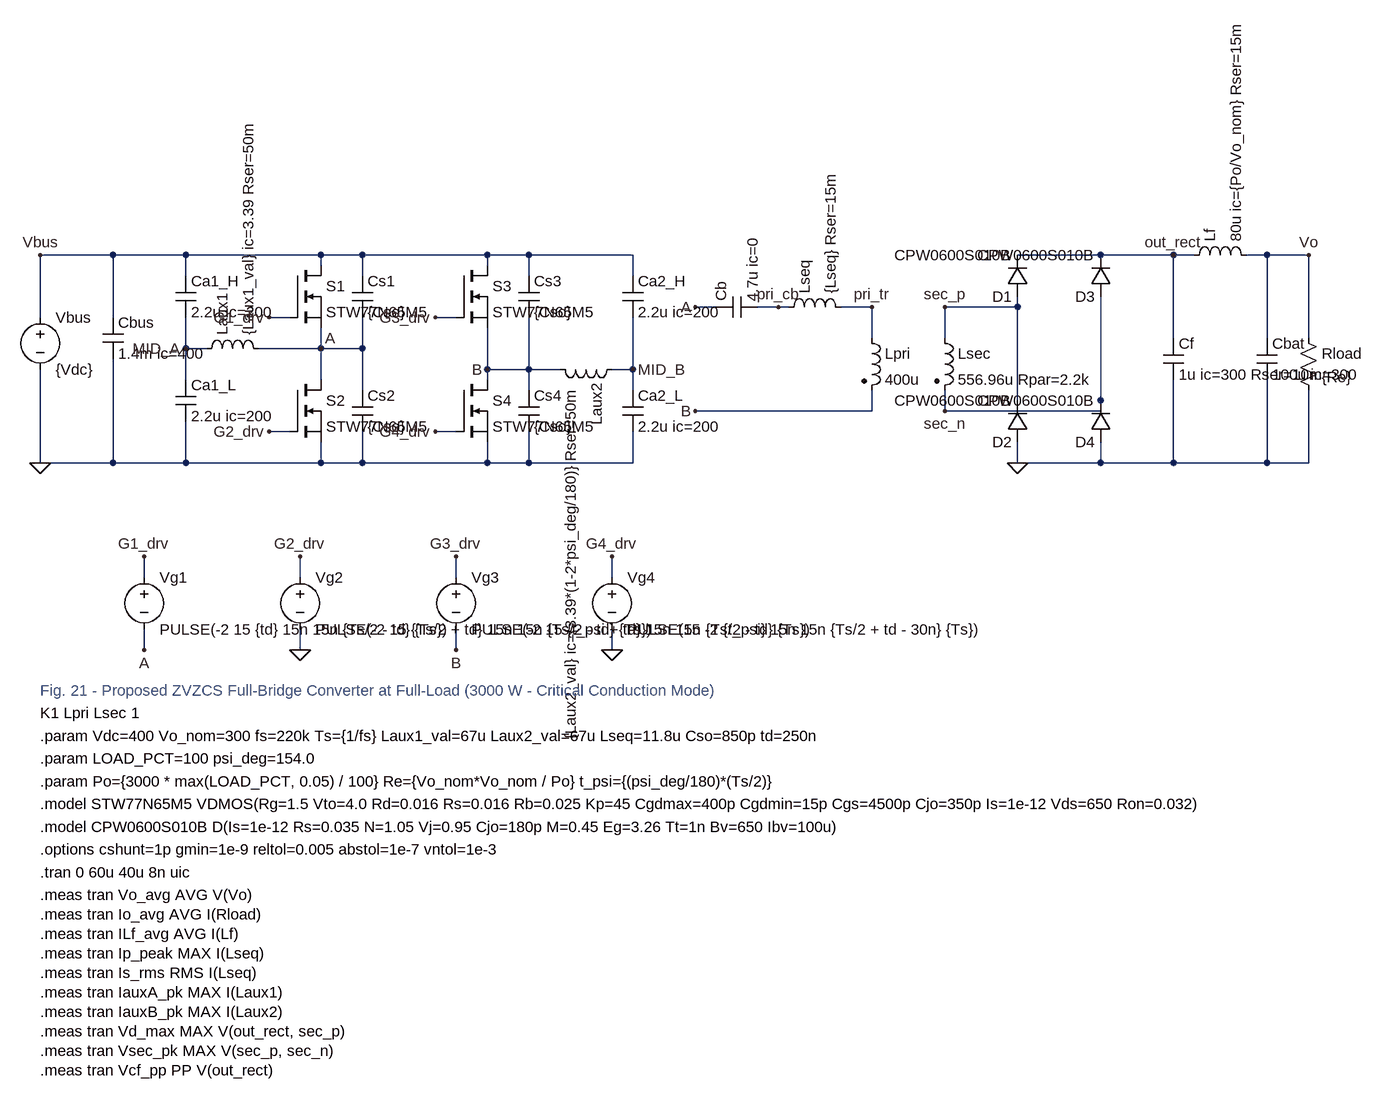
[diagram p0: schematic Fig21_Proposed_100pct_FullLoad_3000W.asc]
Fig21_Proposed_100pct_FullLoad_3000W.asc, the LTspice schematic file:
Version 4
SHEET 1 2400 1500
SYMBOL voltage 160 240 R0
SYMATTR InstName Vbus
SYMATTR Value {Vdc}
WIRE 160 160 160 256
WIRE 160 336 160 480
FLAG 160 480 0
FLAG 160 160 Vbus
SYMBOL cap 256 256 R0
SYMATTR InstName Cbus
SYMATTR Value 1.4m ic=400
WIRE 160 160 272 160
WIRE 272 160 272 256
WIRE 272 320 272 480
WIRE 160 480 272 480
SYMBOL cap 368 192 R0
SYMATTR InstName Ca1_H
SYMATTR Value 2.2u ic=200
WIRE 272 160 384 160
WIRE 384 160 384 192
WIRE 384 256 384 304
FLAG 384 304 MID_A
SYMBOL cap 368 352 R0
SYMATTR InstName Ca1_L
SYMATTR Value 2.2u ic=200
WIRE 384 304 384 352
WIRE 384 416 384 480
WIRE 272 480 384 480
SYMBOL ind 400 320 R270
SYMATTR InstName Laux1
SYMATTR Value {Laux1_val} ic=3.39 Rser=50m
WIRE 384 304 416 304
WIRE 496 304 592 304
SYMBOL nmos 544 176 R0
SYMATTR InstName S1
SYMATTR Value STW77N65M5
WIRE 384 160 592 160
WIRE 592 160 592 176
WIRE 512 256 544 256
FLAG 512 256 G1_drv
WIRE 592 272 592 304
FLAG 592 304 A
SYMBOL cap 640 192 R0
SYMATTR InstName Cs1
SYMATTR Value {Cso}
WIRE 592 160 656 160
WIRE 656 160 656 192
WIRE 656 256 656 304
WIRE 592 304 656 304
SYMBOL nmos 544 352 R0
SYMATTR InstName S2
SYMATTR Value STW77N65M5
WIRE 592 304 592 352
WIRE 512 432 544 432
FLAG 512 432 G2_drv
WIRE 592 448 592 480
WIRE 384 480 592 480
SYMBOL cap 640 368 R0
SYMATTR InstName Cs2
SYMATTR Value {Cso}
WIRE 656 304 656 368
WIRE 656 432 656 480
WIRE 592 480 656 480
SYMBOL nmos 800 176 R0
SYMATTR InstName S3
SYMATTR Value STW77N65M5
WIRE 656 160 848 160
WIRE 848 160 848 176
WIRE 768 256 800 256
FLAG 768 256 G3_drv
WIRE 848 272 848 336
FLAG 848 336 B
SYMBOL cap 896 192 R0
SYMATTR InstName Cs3
SYMATTR Value {Cso}
WIRE 848 160 912 160
WIRE 912 160 912 192
WIRE 912 256 912 336
WIRE 848 336 912 336
SYMBOL nmos 800 352 R0
SYMATTR InstName S4
SYMATTR Value STW77N65M5
WIRE 848 336 848 352
WIRE 768 432 800 432
FLAG 768 432 G4_drv
WIRE 848 448 848 480
WIRE 656 480 848 480
SYMBOL cap 896 368 R0
SYMATTR InstName Cs4
SYMATTR Value {Cso}
WIRE 912 336 912 368
WIRE 912 432 912 480
WIRE 848 480 912 480
SYMBOL ind 1056 320 R90
SYMATTR InstName Laux2
SYMATTR Value {Laux2_val} ic={3.39*(1-2*psi_deg/180)} Rser=50m
WIRE 912 336 960 336
WIRE 1040 336 1072 336
FLAG 1072 336 MID_B
SYMBOL cap 1056 192 R0
SYMATTR InstName Ca2_H
SYMATTR Value 2.2u ic=200
WIRE 912 160 1072 160
WIRE 1072 160 1072 192
WIRE 1072 256 1072 336
SYMBOL cap 1056 368 R0
SYMATTR InstName Ca2_L
SYMATTR Value 2.2u ic=200
WIRE 1072 336 1072 368
WIRE 1072 432 1072 480
WIRE 912 480 1072 480
FLAG 1168 240 A
FLAG 1168 400 B
SYMBOL cap 1200 256 R270
SYMATTR InstName Cb
SYMATTR Value 4.7u ic=0
WIRE 1168 240 1200 240
WIRE 1264 240 1296 240
FLAG 1296 240 pri_cb
SYMBOL ind 1296 256 R270
SYMATTR InstName Lseq
SYMATTR Value {Lseq} Rser=15m
WIRE 1296 240 1312 240
WIRE 1392 240 1440 240
FLAG 1440 240 pri_tr
SYMBOL ind2 1424 272 R0
SYMATTR InstName Lpri
SYMATTR Value 400u
WIRE 1440 240 1440 288
WIRE 1440 368 1440 400
WIRE 1168 400 1440 400
SYMBOL ind2 1536 272 R0
SYMATTR InstName Lsec
SYMATTR Value 556.96u Rpar=2.2k
WIRE 1552 240 1552 288
WIRE 1552 368 1552 400
FLAG 1552 240 sec_p
FLAG 1552 400 sec_n
SYMBOL diode 1680 224 R180
SYMATTR InstName D1
SYMATTR Value CPW0600S010B
WIRE 1664 160 1792 160
WIRE 1664 224 1664 240
WIRE 1552 240 1664 240
SYMBOL diode 1680 448 R180
SYMATTR InstName D2
SYMATTR Value CPW0600S010B
WIRE 1664 240 1664 384
WIRE 1664 448 1664 480
FLAG 1664 480 0
SYMBOL diode 1808 224 R180
SYMATTR InstName D3
SYMATTR Value CPW0600S010B
WIRE 1792 224 1792 400
WIRE 1552 400 1792 400
SYMBOL diode 1808 448 R180
SYMATTR InstName D4
SYMATTR Value CPW0600S010B
WIRE 1792 448 1792 480
WIRE 1664 480 1792 480
WIRE 1792 160 1904 160
FLAG 1904 160 out_rect
SYMBOL cap 1888 288 R0
SYMATTR InstName Cf
SYMATTR Value 1u ic=300 Rser=10m
SYMBOL ind 1920 176 R270
SYMATTR InstName Lf
SYMATTR Value 80u ic={Po/Vo_nom} Rser=15m
SYMBOL cap 2032 288 R0
SYMATTR InstName Cbat
SYMATTR Value 100u ic=300
WIRE 1904 160 1904 288
WIRE 1904 352 1904 480
WIRE 1792 480 1904 480
WIRE 1904 160 1936 160
WIRE 2016 160 2112 160
FLAG 2112 160 Vo
WIRE 2048 160 2048 288
WIRE 2048 352 2048 480
WIRE 1904 480 2048 480
SYMBOL res 2096 272 R0
SYMATTR InstName Rload
SYMATTR Value {Re}
WIRE 2112 160 2112 288
WIRE 2112 368 2112 480
WIRE 2048 480 2112 480
SYMBOL voltage 320 640 R0
SYMATTR InstName Vg1
SYMATTR Value PULSE(-2 15 {td} 15n 15n {Ts/2 - td} {Ts})
WIRE 320 624 320 656
FLAG 320 624 G1_drv
WIRE 320 736 320 768
FLAG 320 768 A
SYMBOL voltage 560 640 R0
SYMATTR InstName Vg2
SYMATTR Value PULSE(-2 15 {Ts/2 + td} 15n 15n {Ts/2 - td} {Ts})
WIRE 560 624 560 656
FLAG 560 624 G2_drv
WIRE 560 736 560 768
FLAG 560 768 0
SYMBOL voltage 800 640 R0
SYMATTR InstName Vg3
SYMATTR Value PULSE(-2 15 {t_psi + td} 15n 15n {Ts/2 - td} {Ts})
WIRE 800 624 800 656
FLAG 800 624 G3_drv
WIRE 800 736 800 768
FLAG 800 768 B
SYMBOL voltage 1040 640 R0
SYMATTR InstName Vg4
SYMATTR Value PULSE(15 -2 {t_psi} 15n 15n {Ts/2 + td - 30n} {Ts})
WIRE 1040 624 1040 656
FLAG 1040 624 G4_drv
WIRE 1040 736 1040 768
FLAG 1040 768 0
TEXT 160 830 Left 2 ;Fig. 21 - Proposed ZVZCS Full-Bridge Converter at Full-Load (3000 W - Critical Conduction Mode)
TEXT 160 865 Left 2 !K1 Lpri Lsec 1
TEXT 160 900 Left 2 !.param Vdc=400 Vo_nom=300 fs=220k Ts={1/fs} Laux1_val=67u Laux2_val=67u Lseq=11.8u Cso=850p td=250n
TEXT 160 935 Left 2 !.param LOAD_PCT=100 psi_deg=154.0
TEXT 160 970 Left 2 !.param Po={3000 * max(LOAD_PCT, 0.05) / 100} Re={Vo_nom*Vo_nom / Po} t_psi={(psi_deg/180)*(Ts/2)}
TEXT 160 1005 Left 2 !.model STW77N65M5 VDMOS(Rg=1.5 Vto=4.0 Rd=0.016 Rs=0.016 Rb=0.025 Kp=45 Cgdmax=400p Cgdmin=15p Cgs=4500p Cjo=350p Is=1e-12 Vds=650 Ron=0.032)
TEXT 160 1040 Left 2 !.model CPW0600S010B D(Is=1e-12 Rs=0.035 N=1.05 Vj=0.95 Cjo=180p M=0.45 Eg=3.26 Tt=1n Bv=650 Ibv=100u)
TEXT 160 1075 Left 2 !.options cshunt=1p gmin=1e-9 reltol=0.005 abstol=1e-7 vntol=1e-3
TEXT 160 1110 Left 2 !.tran 0 60u 40u 8n uic
TEXT 160 1145 Left 2 !.meas tran Vo_avg AVG V(Vo)
TEXT 160 1175 Left 2 !.meas tran Io_avg AVG I(Rload)
TEXT 160 1205 Left 2 !.meas tran ILf_avg AVG I(Lf)
TEXT 160 1235 Left 2 !.meas tran Ip_peak MAX I(Lseq)
TEXT 160 1265 Left 2 !.meas tran Is_rms RMS I(Lseq)
TEXT 160 1295 Left 2 !.meas tran IauxA_pk MAX I(Laux1)
TEXT 160 1325 Left 2 !.meas tran IauxB_pk MAX I(Laux2)
TEXT 160 1355 Left 2 !.meas tran Vd_max MAX V(out_rect, sec_p)
TEXT 160 1385 Left 2 !.meas tran Vsec_pk MAX V(sec_p, sec_n)
TEXT 160 1415 Left 2 !.meas tran Vcf_pp PP V(out_rect)

The netlist it stands for:
* Fig21_Proposed_100pct_FullLoad_3000W.asc
Vbus Vbus 0 {Vdc}
Cbus Vbus 0 1.4m ic=400
Ca1_H Vbus MID_A 2.2u ic=200
Ca1_L MID_A 0 2.2u ic=200
Laux1 MID_A A {Laux1_val} ic=3.39 Rser=50m
M§S1 Vbus G1_drv A A STW77N65M5
Cs1 Vbus A {Cso}
M§S2 A G2_drv 0 0 STW77N65M5
Cs2 A 0 {Cso}
M§S3 Vbus G3_drv B B STW77N65M5
Cs3 Vbus B {Cso}
M§S4 B G4_drv 0 0 STW77N65M5
Cs4 B 0 {Cso}
Laux2 MID_B B {Laux2_val} ic={3.39*(1-2*psi_deg/180)} Rser=50m
Ca2_H Vbus MID_B 2.2u ic=200
Ca2_L MID_B 0 2.2u ic=200
Cb A pri_cb 4.7u ic=0
Lseq pri_cb pri_tr {Lseq} Rser=15m
Lpri pri_tr B 400u
Lsec sec_p sec_n 556.96u Rpar=2.2k
D1 sec_p out_rect CPW0600S010B
D2 0 sec_p CPW0600S010B
D3 sec_n out_rect CPW0600S010B
D4 0 sec_n CPW0600S010B
Cf out_rect 0 1u ic=300 Rser=10m
Lf out_rect Vo 80u ic={Po/Vo_nom} Rser=15m
Cbat Vo 0 100u ic=300
Rload Vo 0 {Re}
Vg1 G1_drv A PULSE(-2 15 {td} 15n 15n {Ts/2 - td} {Ts})
Vg2 G2_drv 0 PULSE(-2 15 {Ts/2 + td} 15n 15n {Ts/2 - td} {Ts})
Vg3 G3_drv B PULSE(-2 15 {t_psi + td} 15n 15n {Ts/2 - td} {Ts})
Vg4 G4_drv 0 PULSE(15 -2 {t_psi} 15n 15n {Ts/2 + td - 30n} {Ts})
.model D D
.lib standard.dio
.model NMOS NMOS
.model PMOS PMOS
.lib standard.mos
* Fig. 21 - Proposed ZVZCS Full-Bridge Converter at Full-Load (3000 W - Critical Conduction Mode)
K1 Lpri Lsec 1
.param Vdc=400 Vo_nom=300 fs=220k Ts={1/fs} Laux1_val=67u Laux2_val=67u Lseq=11.8u Cso=850p td=250n
.param LOAD_PCT=100 psi_deg=154.0
.param Po={3000 * max(LOAD_PCT, 0.05) / 100} Re={Vo_nom*Vo_nom / Po} t_psi={(psi_deg/180)*(Ts/2)}
.model STW77N65M5 VDMOS(Rg=1.5 Vto=4.0 Rd=0.016 Rs=0.016 Rb=0.025 Kp=45 Cgdmax=400p Cgdmin=15p Cgs=4500p Cjo=350p Is=1e-12 Vds=650 Ron=0.032)
.model CPW0600S010B D(Is=1e-12 Rs=0.035 N=1.05 Vj=0.95 Cjo=180p M=0.45 Eg=3.26 Tt=1n Bv=650 Ibv=100u)
.options cshunt=1p gmin=1e-9 reltol=0.005 abstol=1e-7 vntol=1e-3
.tran 0 60u 40u 8n uic
.meas tran Vo_avg AVG V(Vo)
.meas tran Io_avg AVG I(Rload)
.meas tran ILf_avg AVG I(Lf)
.meas tran Ip_peak MAX I(Lseq)
.meas tran Is_rms RMS I(Lseq)
.meas tran IauxA_pk MAX I(Laux1)
.meas tran IauxB_pk MAX I(Laux2)
.meas tran Vd_max MAX V(out_rect, sec_p)
.meas tran Vsec_pk MAX V(sec_p, sec_n)
.meas tran Vcf_pp PP V(out_rect)
.backanno
.end